# Altium project 24V-7A-Power-Board-v2.0.PrjPcb (part 5 of 5)
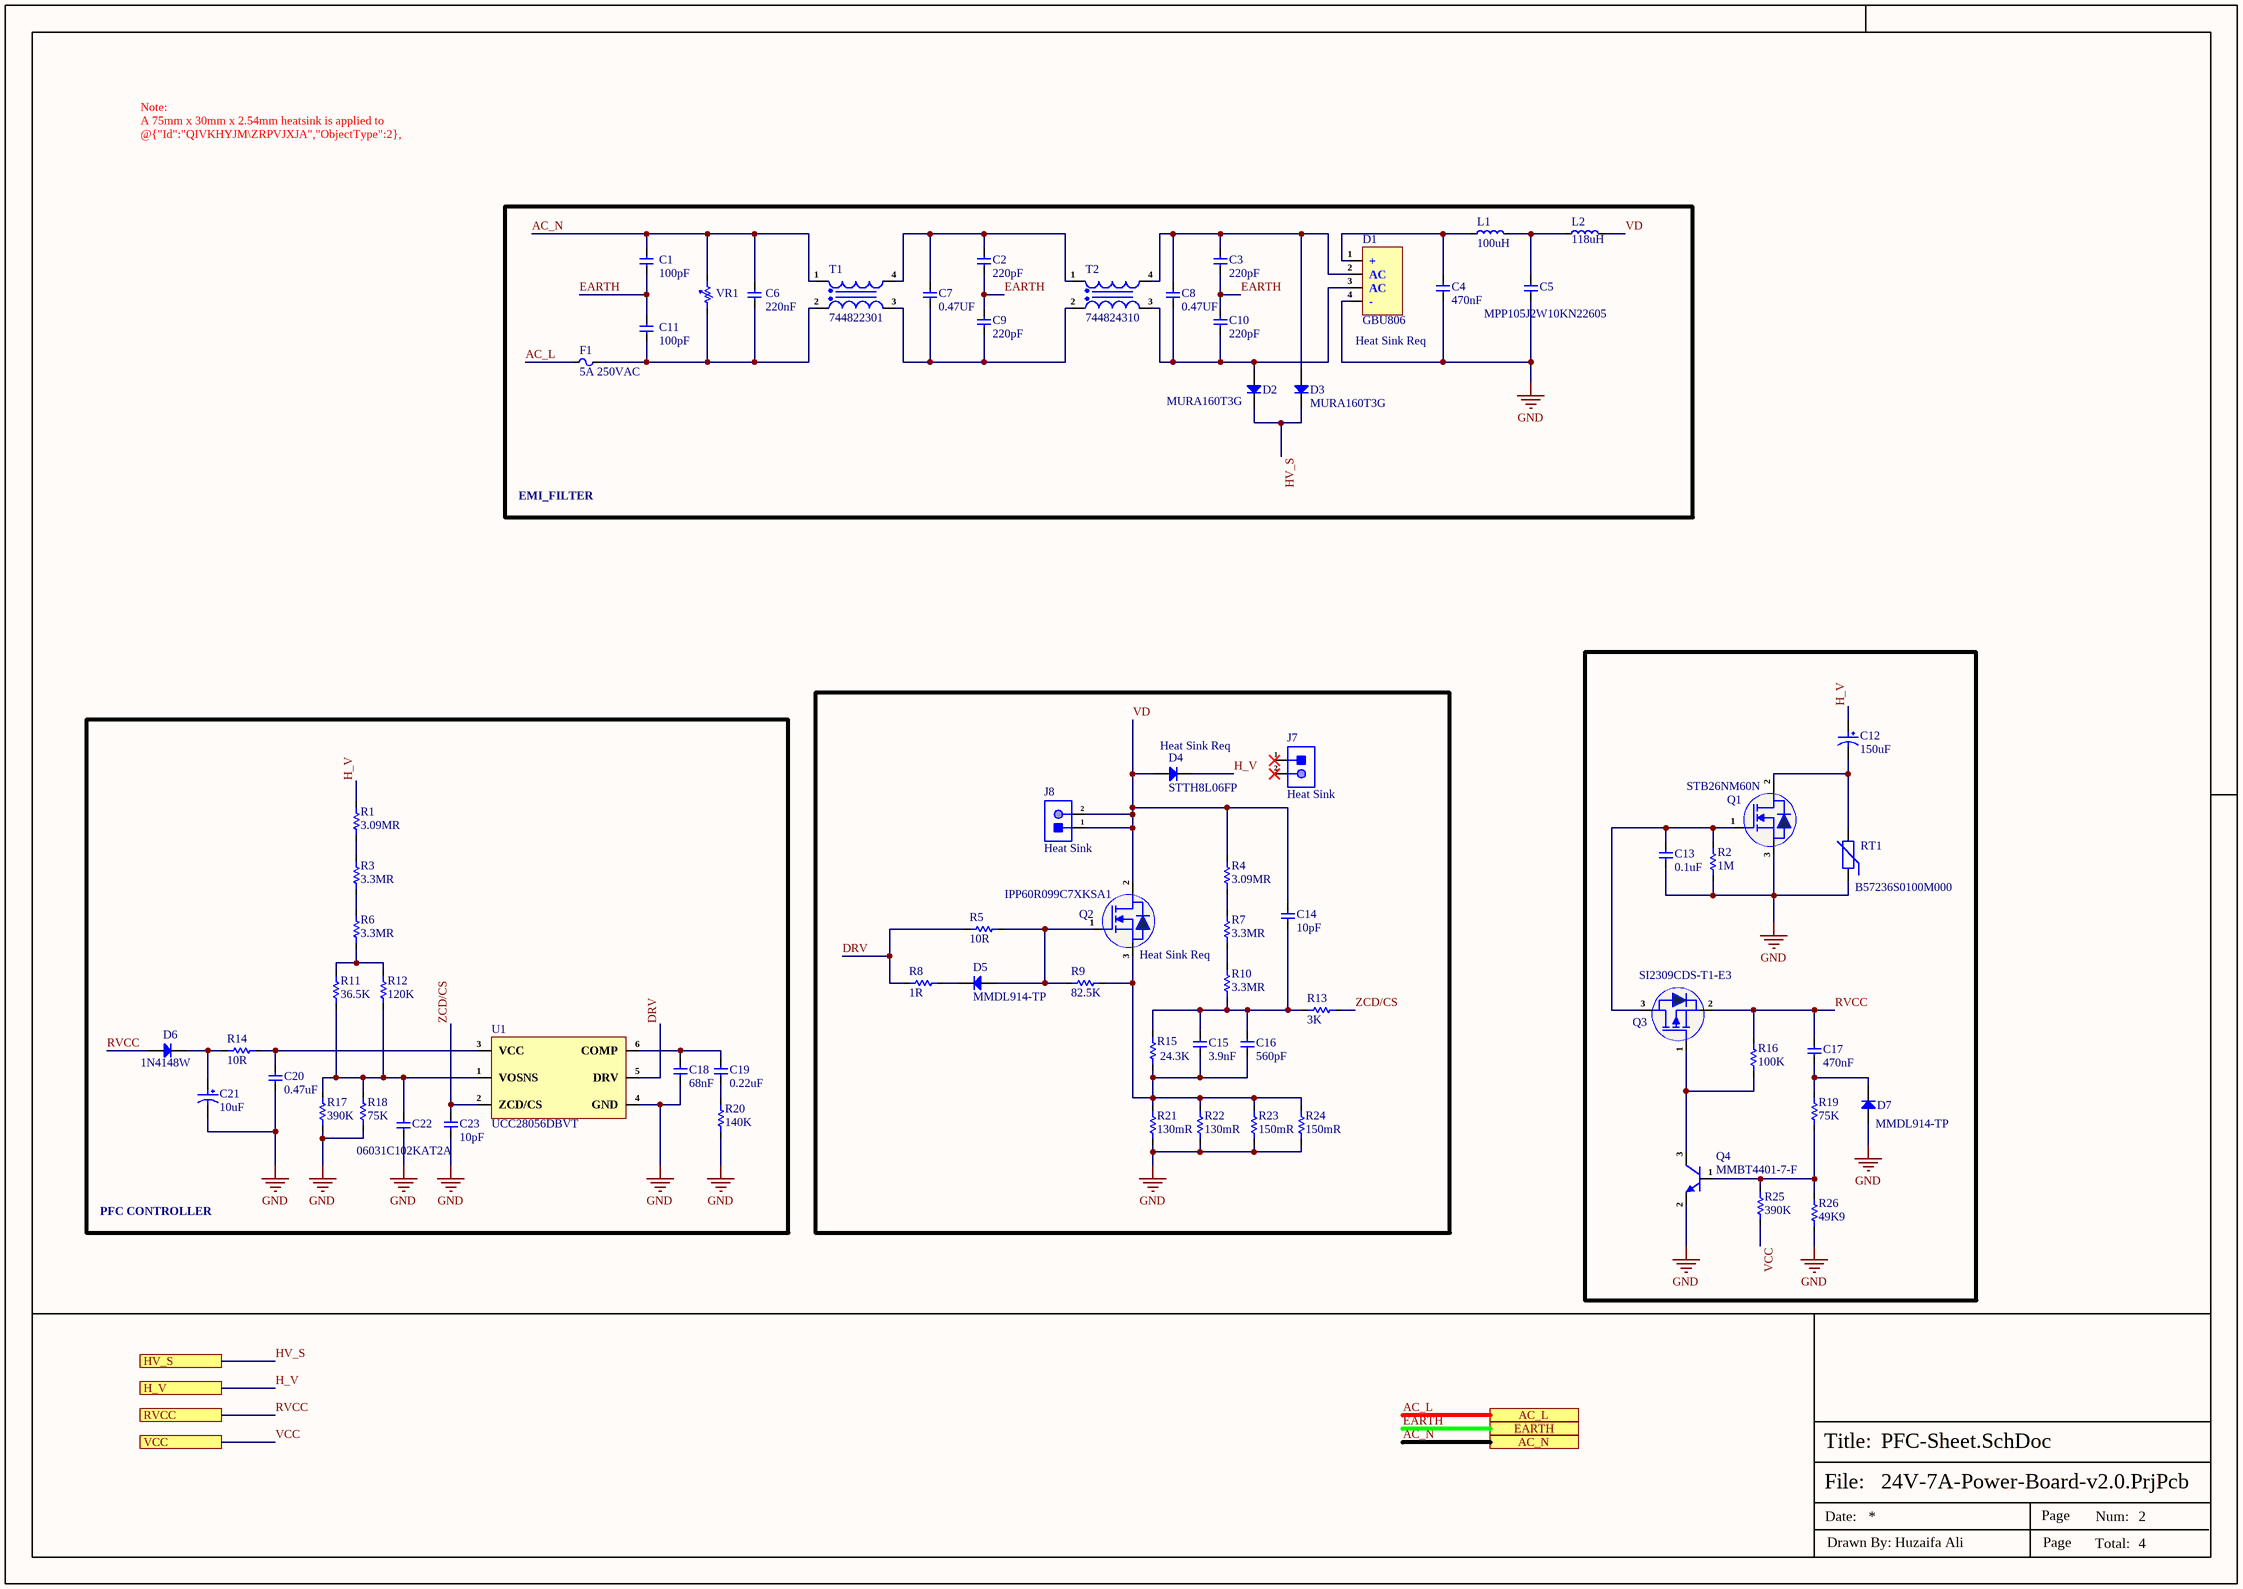
[diagram p7: PFC-Sheet.SchDoc]

## Sheet PFC-Sheet.SchDoc (continued)

### Library data of the parts (continued)
R13 = RC0603FR-073KL: RES 3K OHM 1% 1/10W 0603; Manufacturer: Yageo; Item Type: Resistor; Value: 3kR; Power Rating: 100mW; Voltage Rating: 50V; Temperature Coefficient: 100ppm/°C; Supplier: Avnet; LCSC Part Number: C126358; Manufacturer Part Number: RC0603FR-073KL; RoHS: Yes; Case/Package: 0603; Pins: 2NUMBER; Case Code (Imperial): 0603; Case Code (Metric): 1608; Min Operating Temperature: -55°C; Max Operating Temperature: 155°C; Tolerance: 1%; Packaging: Tape and Reel; Termination: SMD/SMT; Resistor Type: Thick Film; Features: Moisture Resistant; Series: RC; Max Power Dissipation: 100mW; Number of Terminations: 2; Construction: Rectangular; Resistance Tolerance: 1%; Voltage Rating (DC): 50V; Length: 1.6mm; Width: 800um; Depth: 0.8mm; Reach SVHC Compliant: No; Military Standard: Not; RoHS Compliant: Yes; Lead Free: 5697LeadFree; ComponentLink1URL: http://www.farnell.com/datasheets/2167052.pdf?src-supplier=Farnell; ComponentLink1Description: http://www.farnell.com/datasheets/2167052.pdf?src-supplier=Farnell; ComponentLink2URL: http://www.mouser.com/ds/2/447/RC0603-272842.pdf?src-supplier=Mouser; ComponentLink2Description: http://www.mouser.com/ds/2/447/RC0603-272842.pdf?src-supplier=Mouser; ComponentLink3URL: https://www.verical.com/server-webapp/html/getDatasheet?partID=135099&src-supplier=Verical; ComponentLink3Description: https://www.verical.com/server-webapp/html/getDatasheet?partID=135099&src-supplier=Verical; ComponentLink4URL: http://www.farnell.com/datasheets/2167052.pdf?src-supplier=Element14; ComponentLink4Description: http://www.farnell.com/datasheets/2167052.pdf?src-supplier=Element14; ComponentLink5URL: http://www.yageo.com/documents/recent/PYu-RC_Group_51_RoHS_L_10.pdf?src-supplier=Digikey; ComponentLink5Description: http://www.yageo.com/documents/recent/PYu-RC_Group_51_RoHS_L_10.pdf?src-supplier=Digikey; ComponentLink6URL: http://www.yageo.com/documents/recent/PYu-RC_Group_51_RoHS_L_9.pdf?src-supplier=Digikey; ComponentLink6Description: http://www.yageo.com/documents/recent/PYu-RC_Group_51_RoHS_L_9.pdf?src-supplier=Digikey; ComponentLink7URL: https://datasheet.octopart.com/RC0603FR-073KL-Yageo-datasheet-8328172.pdf?src-supplier=Farnell; ComponentLink7Description: https://datasheet.octopart.com/RC0603FR-073KL-Yageo-datasheet-8328172.pdf?src-supplier=Farnell; ComponentLink8URL: http://www.yageo.com/documents/recent/PYu-RC0603_51_RoHS_L_7.pdf?src-supplier=Future+Electronics; ComponentLink8Description: http://www.yageo.com/documents/recent/PYu-RC0603_51_RoHS_L_7.pdf?src-supplier=Future+Electronics; ComponentLink9URL: https://datasheet.octopart.com/RC0603FR-073KL-Yageo-datasheet-34211833.pdf?src-supplier=Element14; ComponentLink9Description: https://datasheet.octopart.com/RC0603FR-073KL-Yageo-datasheet-34211833.pdf?src-supplier=Element14; ComponentLink10URL: http://www.farnell.com/datasheets/1868787.pdf?src-supplier=Newark; ComponentLink10Description: http://www.farnell.com/datasheets/1868787.pdf?src-supplier=Newark; ComponentLink11URL: https://datasheet.octopart.com/RC0603FR-073KL-Yageo-datasheet-164759695.pdf?src-supplier=Future+Electronics; ComponentLink11Description: https://datasheet.octopart.com/RC0603FR-073KL-Yageo-datasheet-164759695.pdf?src-supplier=Future+Electronics
R14 = CRCW080510R0FKEAHP: RES SMD 10 OHM 1% 1/2W 0805; Manufacturer: Vishay; Item Type: Resistor; Power Rating: 330mW; Voltage Rating: 150V; Temperature Coefficient: 100ppm/°C; Max Power Dissipation: 333mW; Supplier: Mouser; LCSC Part Number: C844598; Manufacturer Part Number: CRCW080510R0FKEAHP; RoHS: Yes; Stock: 384044; Pricing: 1=0.19, 10=0.066, 50=0.066, 100=0.04, 1000=0.027, 10000=0.023 (USD); Case/Package: 0805; Weight: 0.000194oz; Case Code (Imperial): 0805; Case Code (Metric): 2012; Contact Plating: Tin; Min Operating Temperature: -55°C; Max Operating Temperature: 155°C; Value: 10R; Tolerance: 1%; Packaging: Tape and Reel; Package Quantity: 5000; Resistor Type: Thick Film; Termination: SMD/SMT; Voltage Rating (DC): 150V; Features: Automotive AEC-Q200; Series: CRCW-HP; Number of Terminations: 2; Resistance Tolerance: 1%; Technology: THICK FILM; Construction: Rectangular; Length: 2mm; Width: 1.2mm; Height: 0.5mm; Depth: 1.25mm; Ratings: AEC-Q200; Radiation Hardening: No; Military Standard: Not; Lead Free: Lead Free; RoHS Compliant: Yes; Reach SVHC Compliant: Unknown; ComponentLink1URL: http://www.farnell.com/datasheets/2884039.pdf?src-supplier=Newark; ComponentLink1Description: http://www.farnell.com/datasheets/2884039.pdf?src-supplier=Newark; ComponentLink2URL: https://datasheet.octopart.com/CRCW080510R0FKEAHP-Vishay-datasheet-87136057.pdf?src-supplier=Newark; ComponentLink2Description: https://datasheet.octopart.com/CRCW080510R0FKEAHP-Vishay-datasheet-87136057.pdf?src-supplier=Newark; ComponentLink3URL: http://www.vishay.com/docs/20043/crcwhpe3.pdf?src-supplier=Digikey; ComponentLink3Description: http://www.vishay.com/docs/20043/crcwhpe3.pdf?src-supplier=Digikey
R15 = RC0603FR-0724K3L: RES 24.3K OHM 1% 1/10W 0603; Manufacturer: Yageo; Item Type: Resistors; Voltage Rating (DC): 50V; Supplier: Future Electronics; Supplier Part Number: 6938161; Manufacturer Part Number: RC0603FR-0724K3L; RoHS: Yes; Stock: 440000; Pricing: 5000=0.0015, 50000=0.0014, 150000=0.0014, 375000=0.0013, 1000000=0.0012 (USD); Lead Free: 5697LeadFree; ComponentLink1URL: https://datasheet.ciiva.com/15189/getdatasheetpartid-326710-15189669.pdf?src-supplier=Verical; ComponentLink1Description: https://datasheet.ciiva.com/15189/getdatasheetpartid-326710-15189669.pdf?src-supplier=Verical
R16 = CRCW0603100KFKEA: RES SMD 100K OHM 1% 1/10W 0603; Item Type: Resistor; Value: 100kR; Temperature Coefficient: 100ppm/°C; Voltage Rating: 75V; Power Rating: 100mW; ComponentLink1Description: LCSC; Supplier: Mouser; Supplier Part Number: 71-CRCW0603-100K-E3; RoHS: Yes; Category: Chip SMD Resistors; Stock: 716604; Pricing: 1=0.1, 10=0.019, 50=0.019, 100=0.009, 1000=0.007, 10000=0.004 (USD); Case/Package: 345Case; Pins: 2NUMBER; Case Code (Imperial): 0603; Case Code (Metric): 1608; Min Operating Temperature: -55°C; Max Operating Temperature: 155°C; Tolerance: 1%; Resistor Type: Thick Film; Resistance Tolerance: 1%; Packaging: 13Packaging; Voltage Rating (DC): 75V; Features: 6309FeaturesType; Height: 500um; RoHS Compliant: Yes; Lead Free: 5697LeadFree; ComponentLink2URL: http://www.farnell.com/datasheets/2310790.pdf?src-supplier=Farnell; ComponentLink2Description: http://www.farnell.com/datasheets/2310790.pdf?src-supplier=Farnell; ComponentLink3URL: https://datasheet.octopart.com/CRCW0603100KFKEA-Vishay-datasheet-14722531.pdf?src-supplier=Newark; ComponentLink3Description: https://datasheet.octopart.com/CRCW0603100KFKEA-Vishay-datasheet-14722531.pdf?src-supplier=Newark; ComponentLink4URL: https://www.vishay.com/docs/20035/dcrcwe3.pdf?src-supplier=Digi-Key; ComponentLink4Description: https://www.vishay.com/docs/20035/dcrcwe3.pdf?src-supplier=Digi-Key; ComponentLink5URL: https://datasheet.octopart.com/CRCW0603100KFKEA-Vishay-datasheet-5300368.pdf?src-supplier=Future+Electronics; ComponentLink5Description: https://datasheet.octopart.com/CRCW0603100KFKEA-Vishay-datasheet-5300368.pdf?src-supplier=Future+Electronics; ComponentLink6URL: http://www.farnell.com/datasheets/2310790.pdf?src-supplier=Newark; ComponentLink6Description: http://www.farnell.com/datasheets/2310790.pdf?src-supplier=Newark; ComponentLink7URL: http://www.farnell.com/datasheets/2310790.pdf?src-supplier=Element14; ComponentLink7Description: http://www.farnell.com/datasheets/2310790.pdf?src-supplier=Element14; ComponentLink8URL: https://datasheet.octopart.com/CRCW0603100KFKEA-Vishay-datasheet-83961561.pdf?src-supplier=Element14; ComponentLink8Description: https://datasheet.octopart.com/CRCW0603100KFKEA-Vishay-datasheet-83961561.pdf?src-supplier=Element14; ComponentLink9URL: https://datasheet.octopart.com/CRCW0603100KFKEA-Vishay-datasheet-8363642.pdf?src-supplier=Verical; ComponentLink9Description: https://datasheet.octopart.com/CRCW0603100KFKEA-Vishay-datasheet-8363642.pdf?src-supplier=Verical; ComponentLink10URL: https://datasheet.octopart.com/CRCW0603100KFKEA-Vishay-datasheet-508714.pdf?src-supplier=Farnell; ComponentLink10Description: https://datasheet.octopart.com/CRCW0603100KFKEA-Vishay-datasheet-508714.pdf?src-supplier=Farnell; ComponentLink11URL: https://datasheet.octopart.com/CRCW0603100KFKEA-Vishay-datasheet-17834126.pdf?src-supplier=TME; ComponentLink11Description: https://datasheet.octopart.com/CRCW0603100KFKEA-Vishay-datasheet-17834126.pdf?src-supplier=TME; LCSC Part Number: C844916
R17 R25 = RC0603FR-07390KL: RES 390K OHM 1% 1/10W 0603; Manufacturer: Yageo; Item Type: Resistor; Value: 390kR; Power Rating: 100mW; Voltage Rating: 50V; Temperature Coefficient: 100ppm/°C; Working Voltage: 75V; Supplier: Avnet; LCSC Part Number: C137735; Manufacturer Part Number: RC0603FR-07390KL; RoHS: Yes; Stock: 3700; Pricing: 1=0.104, 25=0.011, 50=0.009, 100=0.006 (USD); Case/Package: 0603; Pins: 2; Case Code (Imperial): 0603; Case Code (Metric): 1608; Min Operating Temperature: -55°C; Max Operating Temperature: 155°C; Tolerance: 1%; Packaging: Tape and Reel; Voltage Rating (DC): 50V; Termination: SMD/SMT; Resistor Type: Thick Film; Number of Terminations: 2; Max Power Dissipation: 100mW; Features: Moisture Resistant; Series: RC; Resistance Tolerance: 1%; Construction: Rectangular; Technology: THICK FILM; Voltage Rating (AC): 50V; Length: 1.6mm; Width: 0.8mm; Height: 0.45mm; Depth: 0.8mm; Military Standard: Not; RoHS Compliant: Yes; Reach SVHC Compliant: Unknown; Lead Free: 5697LeadFree; ComponentLink1URL: https://datasheet.ciiva.com/11819/0900766b80f96399-11819357.pdf?src-supplier=Rs; ComponentLink1Description: https://datasheet.ciiva.com/11819/0900766b80f96399-11819357.pdf?src-supplier=Rs; ComponentLink2URL: https://datasheet.ciiva.com/5557/rc0603-5557952.pdf?src-supplier=Mouser; ComponentLink2Description: https://datasheet.ciiva.com/5557/rc0603-5557952.pdf?src-supplier=Mouser; ComponentLink3URL: https://datasheet.ciiva.com/2454/pyu-r-int-thick-7-2454247.pdf?src-supplier=Digikey; ComponentLink3Description: https://datasheet.ciiva.com/2454/pyu-r-int-thick-7-2454247.pdf?src-supplier=Digikey; ComponentLink4URL: https://datasheet.ciiva.com/2454/pyu-r-int-thick-7-2454248.pdf?src-supplier=Digikey; ComponentLink4Description: https://datasheet.ciiva.com/2454/pyu-r-int-thick-7-2454248.pdf?src-supplier=Digikey; ComponentLink5URL: https://datasheet.ciiva.com/2454/pyu-r-int-thick-7-2454246.pdf?src-supplier=Digikey; ComponentLink5Description: https://datasheet.ciiva.com/2454/pyu-r-int-thick-7-2454246.pdf?src-supplier=Digikey
R18 R19 = RC0603FR-0775KL: RES 75K OHM 1% 1/10W 0603; Manufacturer: Yageo; Item Type: Resistor; Value: 75kR; Power Rating: 100mW; Voltage Rating: 50V; Temperature Coefficient: 100ppm/°C; Supplier: Future Electronics; LCSC Part Number: C114636; Manufacturer Part Number: RC0603FR-0775KL; RoHS: Yes; Stock: 550000; Pricing: 5000=0.0015, 75000=0.0015, 250000=0.0014, 750000=0.0013, 2500000=0.0012 (USD); Case/Package: 0603; Pins: 2NUMBER; Case Code (Imperial): 0603; Case Code (Metric): 1608; Min Operating Temperature: -55°C; Max Operating Temperature: 155°C; Tolerance: 1%; Packaging: Tape and Reel; Termination: SMD/SMT; Resistor Type: Thick Film; Number of Terminations: 2; Max Power Dissipation: 100mW; Features: Moisture Resistant; Series: RC; Technology: THICK FILM; Resistance Tolerance: 1%; Construction: Rectangular; Voltage Rating (DC): 50V; Length: 1.6mm; Height: 0.45mm; Depth: 0.8mm; RoHS Compliant: Yes; Reach SVHC Compliant: No; Military Standard: Not; Lead Free: 5697LeadFree; ComponentLink1URL: https://datasheet.ciiva.com/11808/0900766b80f96399-11808100.pdf?src-supplier=Rs; ComponentLink1Description: https://datasheet.ciiva.com/11808/0900766b80f96399-11808100.pdf?src-supplier=Rs; ComponentLink2URL: https://datasheet.ciiva.com/15189/getdatasheetpartid-326733-15189816.pdf?src-supplier=Verical; ComponentLink2Description: https://datasheet.ciiva.com/15189/getdatasheetpartid-326733-15189816.pdf?src-supplier=Verical; ComponentLink3URL: https://datasheet.ciiva.com/2455/pyu-r-int-thick-7-2455324.pdf?src-supplier=Digikey; ComponentLink3Description: https://datasheet.ciiva.com/2455/pyu-r-int-thick-7-2455324.pdf?src-supplier=Digikey; ComponentLink4URL: https://datasheet.ciiva.com/2455/pyu-r-int-thick-7-2455325.pdf?src-supplier=Digikey; ComponentLink4Description: https://datasheet.ciiva.com/2455/pyu-r-int-thick-7-2455325.pdf?src-supplier=Digikey; ComponentLink5URL: https://datasheet.ciiva.com/2455/pyu-r-int-thick-7-2455323.pdf?src-supplier=Digikey; ComponentLink5Description: https://datasheet.ciiva.com/2455/pyu-r-int-thick-7-2455323.pdf?src-supplier=Digikey; ComponentLink6URL: https://datasheet.ciiva.com/46395/443971-46395017.pdf?src-supplier=Element14; ComponentLink6Description: https://datasheet.ciiva.com/46395/443971-46395017.pdf?src-supplier=Element14
R20 = RC0603FR-07140KL: RES 140K OHM 1% 1/10W 0603; Manufacturer: Yageo; Item Type: Resistor; Voltage Rating (DC): 50V; Supplier: Future Electronics; LCSC Part Number: C185372; Manufacturer Part Number: RC0603FR-07140KL; RoHS: Yes; Stock: 215000; Pricing: 5000=0.0015, 50000=0.0014, 150000=0.0014, 375000=0.0013, 1000000=0.0012 (USD); Lead Free: 5697LeadFree; ComponentLink1URL: https://datasheet.ciiva.com/2453/pyu-r-int-thick-7-2453916.pdf?src-supplier=Digikey; ComponentLink1Description: https://datasheet.ciiva.com/2453/pyu-r-int-thick-7-2453916.pdf?src-supplier=Digikey; ComponentLink2URL: https://datasheet.ciiva.com/2453/pyu-r-int-thick-7-2453917.pdf?src-supplier=Digikey; ComponentLink2Description: https://datasheet.ciiva.com/2453/pyu-r-int-thick-7-2453917.pdf?src-supplier=Digikey; ComponentLink3URL: https://datasheet.ciiva.com/2453/pyu-r-int-thick-7-2453918.pdf?src-supplier=Digikey; ComponentLink3Description: https://datasheet.ciiva.com/2453/pyu-r-int-thick-7-2453918.pdf?src-supplier=Digikey
R21 R22 = CSR1206FTR130: 500mW Thick Film Resistors ±100ppm/℃ ±1% 130mΩ 1206 Chip Resistor - Surface Mount ROHS; Manufacturer: SEI(Stackpole Elec); Manufacturer Part Number: CSR1206FTR130; Package: 1206; LCSC Part Number: C346779; Item Type: Resistor; ComponentLink1Description: LCSC; ComponentLink1URL: https://www.lcsc.com/product-detail/Chip-Resistor-Surface-Mount_SEI-Stackpole-Elec-CSR1206FTR130_C346779.html
R23 R24 = RL1206FR-7W0R15L: RES 0.15 OHM 1% 1/2W 1206; Manufacturer: YAGEO; Item Type: Resistor; Manufacturer Part Number: RL1206FR-7W0R15L; Package: 1206; LCSC Part Number: C859925; ComponentLink1Description: LCSC; ComponentLink1URL: https://www.lcsc.com/product-detail/Chip-Resistor-Surface-Mount_YAGEO-RL1206FR-7W0R15L_C859925.html
R26 = RC0603FR-0749K9L: RES 49.9K OHM 1% 1/10W 0603; Manufacturer: Yageo; Power Rating: 100mW; Resistance: 49.9kR; Temperature Coefficient: 100ppm/°C; Voltage Rating (DC): 50V; Item Type: Resistor; Supplier 1: Digi-Key; Manufacturer Part Number: RC0603FR-0749K9L; RoHS: Yes; Category: Chip SMD Resistors; Stock 1: 77863; Pricing 1: 1=0.10000, 10=0.02400, 100=0.00970, 1000=0.00436, 2500=0.00378 (USD); Mount: Surface Mount; Case/Package: 0603; Case Code (Metric): 1608; Case Code (Imperial): 0603; Size Code: 0603; Min Operating Temperature: -55°C; Max Operating Temperature: 155°C; Tolerance: 1%; Packaging: Tape and Reel; Package Quantity: 1; Voltage Rating: 50V; Resistor Type: Thick Film; Number of Terminations: 2; Termination: SMD/SMT; Max Power Dissipation: 100mW; Features: Moisture Resistant; Series: RC; Construction: Rectangular; Length: 0.063inch; Width: 0.031inch; Height: 0.022inch; Depth: 0.8mm; Lead Free: Lead Free; Military Standard: Not; RoHS Compliant: Yes; ComponentLink1URL: https://datasheet.ciiva.com/2454/pyu-r-int-thick-7-2454042.pdf?src-supplier=Digi-Key; ComponentLink1Description: https://datasheet.ciiva.com/2454/pyu-r-int-thick-7-2454042.pdf?src-supplier=Digi-Key; ComponentLink2URL: https://datasheet.ciiva.com/2454/pyu-r-int-thick-7-2454043.pdf?src-supplier=Digi-Key; ComponentLink2Description: https://datasheet.ciiva.com/2454/pyu-r-int-thick-7-2454043.pdf?src-supplier=Digi-Key; ComponentLink3URL: https://datasheet.ciiva.com/2454/pyu-r-int-thick-7-2454044.pdf?src-supplier=Digi-Key; ComponentLink3Description: https://datasheet.ciiva.com/2454/pyu-r-int-thick-7-2454044.pdf?src-supplier=Digi-Key; ComponentLink4URL: https://datasheet.ciiva.com/15189/getdatasheetpartid-323805-15189749.pdf?src-supplier=Verical; ComponentLink4Description: https://datasheet.ciiva.com/15189/getdatasheetpartid-323805-15189749.pdf?src-supplier=Verical; Supplier Part Number 1: 311-49.9KHRCT-ND; LCSC Part Number: C114624
RT1 = B57236S0100M000: ICL 10 OHM 20% 3.5A 11.5MM; Manufacturer: TDK EPCOS; Item Type: Thermistors; Supplier: Mouser; LCSC Part Number: C125458; Manufacturer Part Number: B57236S0100M000; RoHS: Yes; Stock: 2235; Pricing: 1=0.84, 10=0.78, 50=0.646, 100=0.572, 1000=0.44, 10000=0.373 (USD); Current Rating: 3.5A; Tolerance: 20%; Diameter: 11.5mm; Thickness: 6mm; Lead Free: 5697LeadFree; ComponentLink1URL: https://datasheet.ciiva.com/15097/getdatasheetpartid-119550-15097692.pdf?src-supplier=Verical; ComponentLink1Description: https://datasheet.ciiva.com/15097/getdatasheetpartid-119550-15097692.pdf?src-supplier=Verical; ComponentLink2URL: https://datasheet.ciiva.com/1321/1851770-1321676.pdf?src-supplier=Element14; ComponentLink2Description: https://datasheet.ciiva.com/1321/1851770-1321676.pdf?src-supplier=Element14
T1 = 744822301: CMC 1MH 3A 2LN TH; Manufacturer: Wurth Electronics; Item Type: Inductor; Supplier: Digikey; Supplier Part Number: 732-1439-ND; Manufacturer Part Number: 744822301; RoHS: Yes; Stock: 1589; Pricing: 1=4.57, 10=4.5, 50=3.57, 140=3.41, 280=3.1 (USD); ComponentLink1URL: https://datasheet.ciiva.com/4952/744822301-91864-4952415.pdf?src-supplier=Mouser; ComponentLink1Description: https://datasheet.ciiva.com/4952/744822301-91864-4952415.pdf?src-supplier=Mouser; ComponentLink2URL: https://datasheet.ciiva.com/11796/0900766b804ac271-11796688.pdf?src-supplier=Rs; ComponentLink2Description: https://datasheet.ciiva.com/11796/0900766b804ac271-11796688.pdf?src-supplier=Rs; ComponentLink3URL: https://datasheet.ciiva.com/7211/70388-7211253.pdf?src-supplier=Newark; ComponentLink3Description: https://datasheet.ciiva.com/7211/70388-7211253.pdf?src-supplier=Newark; ComponentLink4URL: https://datasheet.ciiva.com/7754/1736520-7754735.pdf?src-supplier=Element14; ComponentLink4Description: https://datasheet.ciiva.com/7754/1736520-7754735.pdf?src-supplier=Element14; ComponentLink5URL: https://datasheet.ciiva.com/6216/744822301-6216281.pdf?src-supplier=Digikey; ComponentLink5Description: https://datasheet.ciiva.com/6216/744822301-6216281.pdf?src-supplier=Digikey
T2 = 744824310: CMC 10MH 3A 2LN TH; Manufacturer: Wurth Electronics; Item Type: Common Mode Chokes; Tolerance: 30%; Test Frequency: 10kHz; Number of Lines: 2; DC Resistance (DCR): 105mR; Supplier: Digikey; Supplier Part Number: 732-1452-ND; Manufacturer Part Number: 744824310; RoHS: Yes; Stock: 278; Pricing: 1=5.63, 10=5.54, 100=4.39, 250=4.2, 500=3.82 (USD); Mounting Technology: Through Hole,Radial; Case/Package: L; Pins: 4; Min Operating Temperature: -40°C; Max Operating Temperature: 125°C; Current Rating: 3A; Packaging: Bulk; Value: 10mH; Max DC Current: 3A; Termination: Radial; Series: WE-CMB; Inductance Tolerance: 30%; Package Quantity: 200; Current: 3A; Length: 27.5mm; Width: 18.5mm; Height: 33mm; Lead Pitch: 10mm; Depth: 18.5mm; Reach SVHC Compliant: No; RoHS Compliant: Yes; Lead Free: Lead Free; ComponentLink1URL: https://datasheet.ciiva.com/11796/0900766b804acf58-11796710.pdf?src-supplier=Rs; ComponentLink1Description: https://datasheet.ciiva.com/11796/0900766b804acf58-11796710.pdf?src-supplier=Rs; ComponentLink2URL: https://datasheet.ciiva.com/4952/744824310-39306-4952431.pdf?src-supplier=Mouser; ComponentLink2Description: https://datasheet.ciiva.com/4952/744824310-39306-4952431.pdf?src-supplier=Mouser; ComponentLink3URL: https://datasheet.ciiva.com/6214/744824310-6214810.pdf?src-supplier=Digikey; ComponentLink3Description: https://datasheet.ciiva.com/6214/744824310-6214810.pdf?src-supplier=Digikey; ComponentLink4URL: https://datasheet.ciiva.com/7211/70411-7211262.pdf?src-supplier=Newark; ComponentLink4Description: https://datasheet.ciiva.com/7211/70411-7211262.pdf?src-supplier=Newark; ComponentLink5URL: https://datasheet.ciiva.com/7754/1736534-7754741.pdf?src-supplier=Element14; ComponentLink5Description: https://datasheet.ciiva.com/7754/1736534-7754741.pdf?src-supplier=Element14; ComponentLink6URL: https://datasheet.ciiva.com/48690/001088035-da-01-ml-we-cmb-stromkomp-netzdrossel-74482-de-en-48690603.pdf?src-supplier=Conrad; ComponentLink6Description: https://datasheet.ciiva.com/48690/001088035-da-01-ml-we-cmb-stromkomp-netzdrossel-74482-de-en-48690603.pdf?src-supplier=Conrad
U1 = UCC28056DBVT: IC PFC CTRLR TRANSITION SOT23-6; Manufacturer: Texas Instruments; Manufacturer Part Number: UCC28056DBVT; Package: SOT-23-6; LCSC Part Number: C2868631; Item Type: IC; ComponentLink1Description: LCSC; ComponentLink1URL: https://www.lcsc.com/product-detail/AC-DC-Controllers-Regulators_Texas-Instruments-UCC28056DBVT_C2868631.html
VR1 = B72210S2271K101: VARISTOR 430V 3.5KA DISC 10MM; Manufacturer: TDK EPCOS; Item Type: Varistors; Value: 195pF; Number of Circuits: 1; Max Voltage Rating (AC): 275V; Max Voltage Rating (DC): 350V; Energy: 55J; Min Varistor Voltage: 387V; Max Varistor Voltage: 473V; Clamping Current: 25A; Clamping Voltage: 710V; Lead/Base Style: Radial; Voltage Tolerance: 10%; Power Rating: 400mW; ESD Protection: 5898YesNo; Supplier: Avnet; LCSC Part Number: C210564; Manufacturer Part Number: B72210S2271K101; RoHS: Yes; Stock: 5700; Pricing: 1=0.12365, 10=0.12192, 30=0.12018, 50=0.11845, 100=0.11671 (USD); Mounting Technology: Through Hole; Case/Package: Radial; Contact Plating: 154ConductorMaterial; Weight: 2.000002g; Material: 4240ConductorMaterial; Min Operating Temperature: -40°C; Max Operating Temperature: 85°C; Packaging: Bulk; Varistor Voltage: 430V; Max Surge Current: 3.5kA; Series: AdvanceD; Voltage Rating: 350V; Voltage Rating (AC): 275V; Voltage Rating (DC): 350V; Termination: 4745ConnectorType; Tolerance: 10%; Current Rating: 25A; Diameter: 12mm; Height: 14.5mm; Lead Pitch: 7.5mm; Depth: 5.4mm; Radiation Hardening: 5898YesNo; RoHS Compliant: Yes; Reach SVHC Compliant: Unknown; Flammability Rating: 5813Flammability; ComponentLink1URL: http://www.farnell.com/datasheets/1680955.pdf?src-supplier=Farnell; ComponentLink1Description: http://www.farnell.com/datasheets/1680955.pdf?src-supplier=Farnell; ComponentLink2URL: http://www.farnell.com/datasheets/2311597.pdf?src-supplier=Farnell; ComponentLink2Description: http://www.farnell.com/datasheets/2311597.pdf?src-supplier=Farnell; ComponentLink3URL: http://components.arrow.com/part/dataview/30869957S9461734N9769?src-supplier=Arrow+Electronics; ComponentLink3Description: http://components.arrow.com/part/dataview/30869957S9461734N9769?src-supplier=Arrow+Electronics; ComponentLink4URL: http://www.farnell.com/datasheets/1680955.pdf?src-supplier=Element14; ComponentLink4Description: http://www.farnell.com/datasheets/1680955.pdf?src-supplier=Element14; ComponentLink5URL: http://www.farnell.com/datasheets/2311597.pdf?src-supplier=Newark; ComponentLink5Description: http://www.farnell.com/datasheets/2311597.pdf?src-supplier=Newark; ComponentLink6URL: http://datasheet.octopart.com/B72210S2271K101-EPCOS-datasheet-11546246.pdf?src-supplier=Distrelec; ComponentLink6Description: http://datasheet.octopart.com/B72210S2271K101-EPCOS-datasheet-11546246.pdf?src-supplier=Distrelec; ComponentLink7URL: https://en.tdk.eu/inf/70/db/var/SIOV_Leaded_AdvanceD.pdf?src-supplier=Digikey; ComponentLink7Description: https://en.tdk.eu/inf/70/db/var/SIOV_Leaded_AdvanceD.pdf?src-supplier=Digikey; ComponentLink8URL: https://datasheet.octopart.com/S10K275E2-EPCOS-datasheet-5104.pdf?src-supplier=Future+Electronics; ComponentLink8Description: https://datasheet.octopart.com/S10K275E2-EPCOS-datasheet-5104.pdf?src-supplier=Future+Electronics; ComponentLink9URL: http://datasheet.octopart.com/B72210S2271K101-EPCOS-datasheet-11546246.pdf?src-supplier=Mouser; ComponentLink9Description: http://datasheet.octopart.com/B72210S2271K101-EPCOS-datasheet-11546246.pdf?src-supplier=Mouser; ComponentLink10URL: https://datasheet.octopart.com/B72210S2271K101-EPCOS-datasheet-11546246.pdf?src-supplier=Newark; ComponentLink10Description: https://datasheet.octopart.com/B72210S2271K101-EPCOS-datasheet-11546246.pdf?src-supplier=Newark; ComponentLink11URL: http://datasheet.octopart.com/B72210S2271K101-EPCOS-datasheet-11546246.pdf?src-supplier=Avnet; ComponentLink11Description: http://datasheet.octopart.com/B72210S2271K101-EPCOS-datasheet-11546246.pdf?src-supplier=Avnet; ComponentLink12URL: http://www.epcos.com/inf/70/db/var_08/SIOV_Leaded_StandarD.pdf?src-supplier=Future+Electronics; ComponentLink12Description: http://www.epcos.com/inf/70/db/var_08/SIOV_Leaded_StandarD.pdf?src-supplier=Future+Electronics; ComponentLink13URL: http://datasheet.octopart.com/B72210S2271K101-EPCOS-datasheet-11546246.pdf?src-supplier=Verical; ComponentLink13Description: http://datasheet.octopart.com/B72210S2271K101-EPCOS-datasheet-11546246.pdf?src-supplier=Verical; ComponentLink14URL: http://datasheet.octopart.com/B72210S2271K101-EPCOS-datasheet-11546246.pdf?src-supplier=TME; ComponentLink14Description: http://datasheet.octopart.com/B72210S2271K101-EPCOS-datasheet-11546246.pdf?src-supplier=TME; ComponentLink15URL: http://datasheet.octopart.com/B72210S2271K101-EPCOS-datasheet-11546246.pdf?src-supplier=TTI; ComponentLink15Description: http://datasheet.octopart.com/B72210S2271K101-EPCOS-datasheet-11546246.pdf?src-supplier=TTI; ComponentLink16URL: http://datasheet.octopart.com/B72210S2271K101-EPCOS-datasheet-11546246.pdf?src-supplier=Rutronik; ComponentLink16Description: http://datasheet.octopart.com/B72210S2271K101-EPCOS-datasheet-11546246.pdf?src-supplier=Rutronik

## Sheet Connector-Sheet.SchDoc
size 420 x 297 mm; SheetNumber: 4; SheetTotal: 4
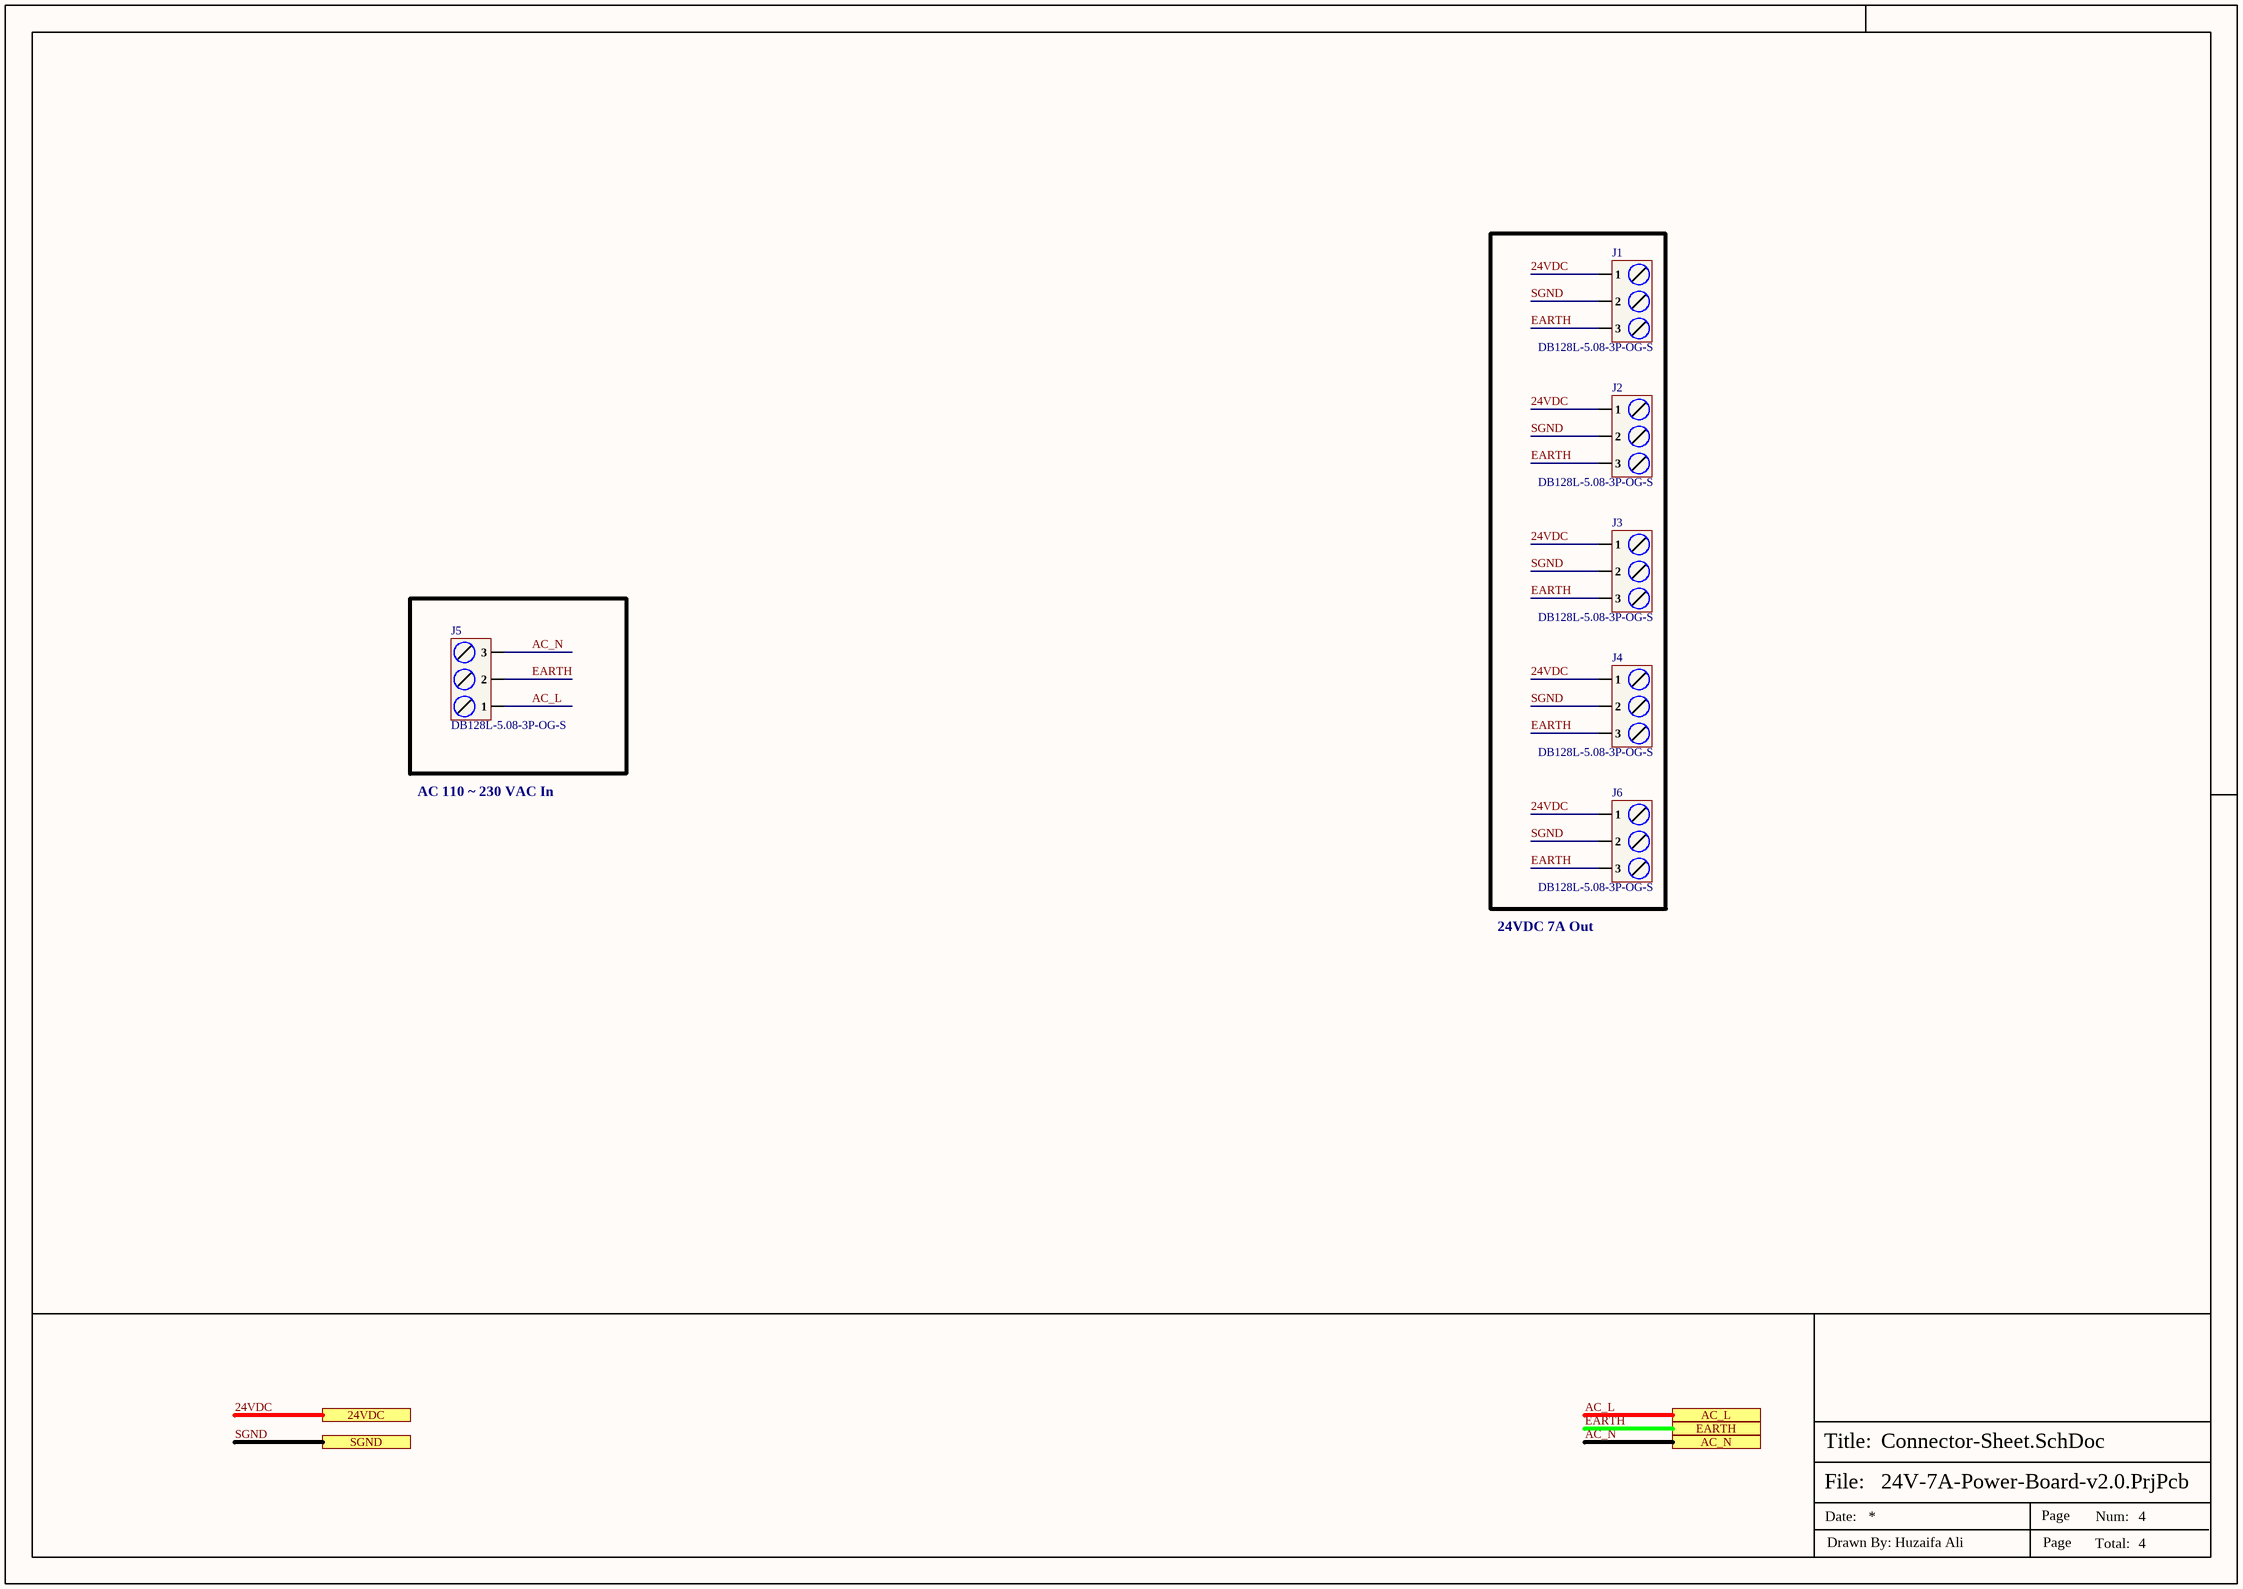
[diagram p3: Connector-Sheet.SchDoc]

### Parts
J1  DB128L-5.08-3P-OG-S  [DB128L-5.08-3P-OG-S]
J2  DB128L-5.08-3P-OG-S  [DB128L-5.08-3P-OG-S]
J3  DB128L-5.08-3P-OG-S  [DB128L-5.08-3P-OG-S]
J4  DB128L-5.08-3P-OG-S  [DB128L-5.08-3P-OG-S]
J5  DB128L-5.08-3P-OG-S  [DB128L-5.08-3P-OG-S]
J6  DB128L-5.08-3P-OG-S  [DB128L-5.08-3P-OG-S]

### Ports
24VDC (see Top-Sheet[3B], Power_Controller-Sheet[1D]), AC_L (see Top-Sheet[3B], PFC-Sheet[4D]), AC_N (see Top-Sheet[3B], PFC-Sheet[4D]), EARTH (see Top-Sheet[3B], PFC-Sheet[4D]), SGND (see Top-Sheet[3B], Power_Controller-Sheet[1D])

### Nets
AC_L: J5.1 ; port AC_L
AC_N: J5.3 ; port AC_N
EARTH: J1.3 J2.3 J3.3 J4.3 J5.2 J6.3 ; port EARTH
SGND: J1.2 J2.2 J3.2 J4.2 J6.2 ; port SGND
24VDC: J1.1 J2.1 J3.1 J4.1 J6.1 ; port 24VDC

### Notes on the sheet
- AC 110 ~ 230 VAC In
- 24VDC 7A Out
- File:
- Title:
- Date:
- Page
- Num:
- Total:
- Drawn By: Huzaifa Ali

### Library data of the parts
J1-J6 = DB128L-5.08-3P-OG-S: 1x3P 18A -40℃~+105℃ 250V Orange 12~30 Direct Insert 5.08mm 2.5 1 3 Plugin,P=5.08mm Screw Terminal Blocks ROHS; Manufacturer: DORABO; Manufacturer Part Number: DB128L-5.08-3P-OG-S; Package: Plugin,P=5.08mm; LCSC Part Number: C430604; Item Type: Terminal Block; ComponentLink1Description: LCSC; ComponentLink1URL: https://www.lcsc.com/product-detail/Screw-Terminal-Blocks_DORABO-DB128L-5-08-3P-OG-S_C430604.html

## Nets that join several sheets
AC_L: PFC-Sheet (F1.1), Connector-Sheet (J5.1)
AC_N: PFC-Sheet (C1.2 C6.2 T1.1 VR1.2), Connector-Sheet (J5.3)
EARTH: PFC-Sheet (6 pins), Connector-Sheet (6 pins)
GND: Power_Controller-Sheet (27 pins), PFC-Sheet (23 pins)
SGND: Power_Controller-Sheet (23 pins), Connector-Sheet (5 pins)
24VDC: Power_Controller-Sheet (19 pins), Connector-Sheet (5 pins)
H_V: Power_Controller-Sheet (C25.1 R43.2 U2.2), PFC-Sheet (C12.1 D4.1 R1.2)
HV_S: Power_Controller-Sheet (R39.1), PFC-Sheet (D2.1 D3.1)
RVCC: Power_Controller-Sheet (7 pins), PFC-Sheet (C17.2 D6.1 Q3.2 R16.2)
VCC: Power_Controller-Sheet (C50.2 D13.1 Q6.3), PFC-Sheet (R25.1)